# Altium project P.PrjPcb
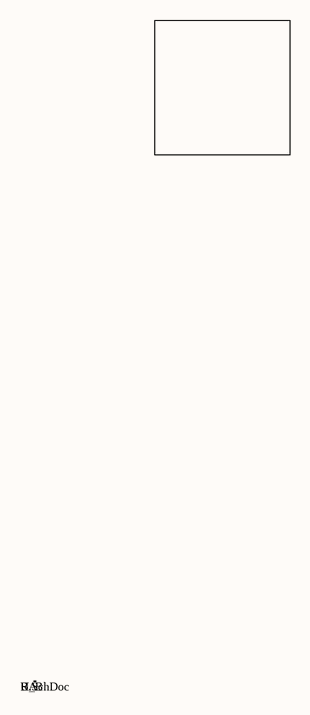
[diagram p0: A.SchDoc]
2 sheets, 2 parts. Net scope: global (net labels, ports and power ports of the same name join across sheets).
Sheets:
  A.SchDoc
    U_B = B.SchDoc

## Sheet A.SchDoc
size A4

### Parts
RA  (no value)

### Sub-sheets
U_B = B.SchDoc: no entries

### Nets

Not connected (* = marked no-connect by the designer): RA 1(A)

### Library data of the parts
RA = RES

## Sheet B.SchDoc
size A4
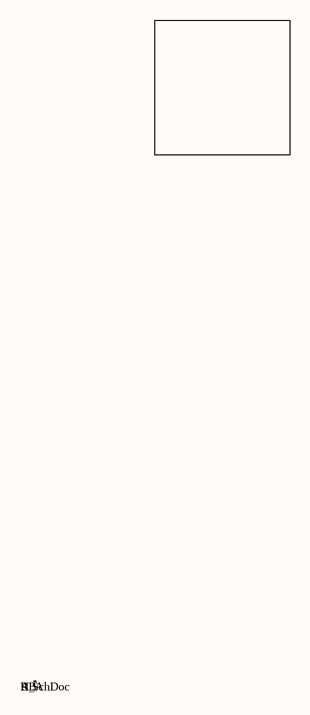
[diagram p1: B.SchDoc]

### Parts
RB  (no value)

### Sub-sheets
U_A = A.SchDoc: no entries

### Nets

Not connected (* = marked no-connect by the designer): RB 1(A)

### Library data of the parts
RB = RES